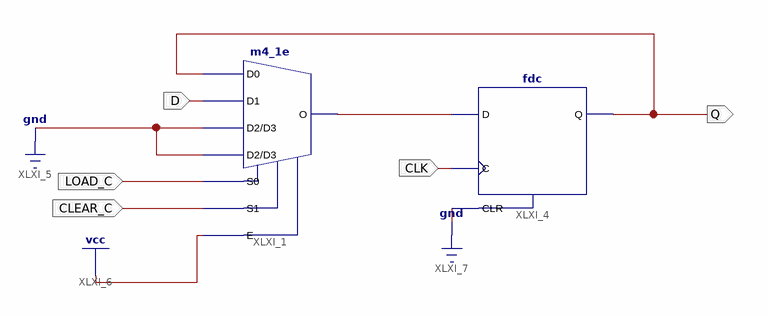
[diagram p0: schematic sheet 1]
// Xilinx ISE schematic REGIS.sch (spartan3e) as structural Verilog: 2 symbols, 5 ports
module REGIS (
  input  D,
  input  CLEAR_C,
  input  LOAD_C,
  input  CLK,
  output Q
);

  wire XLXN_3;

  m4_1e XLXI_1 (.D0(Q), .D1(D), .D2(1'b0), .D3(1'b0), .E(1'b1), .S0(LOAD_C), .S1(CLEAR_C), .O(XLXN_3));
  fdc XLXI_4 (.C(CLK), .CLR(1'b0), .D(XLXN_3), .Q(Q));
endmodule
